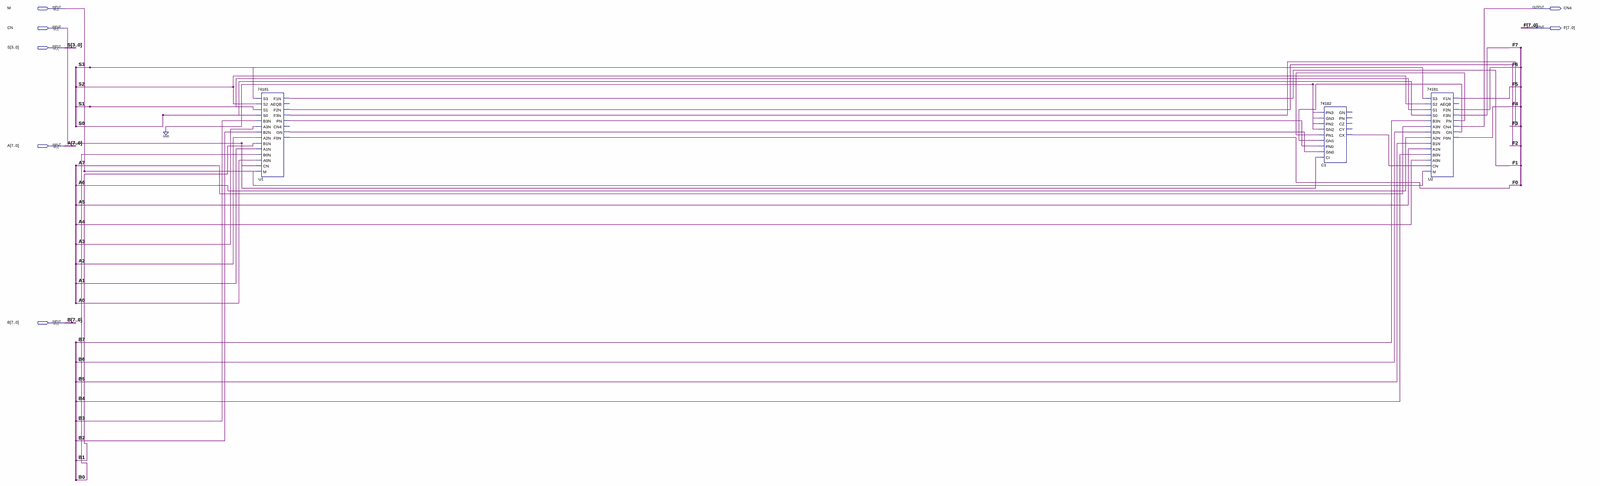
[diagram p0: schematic sheet, whole]
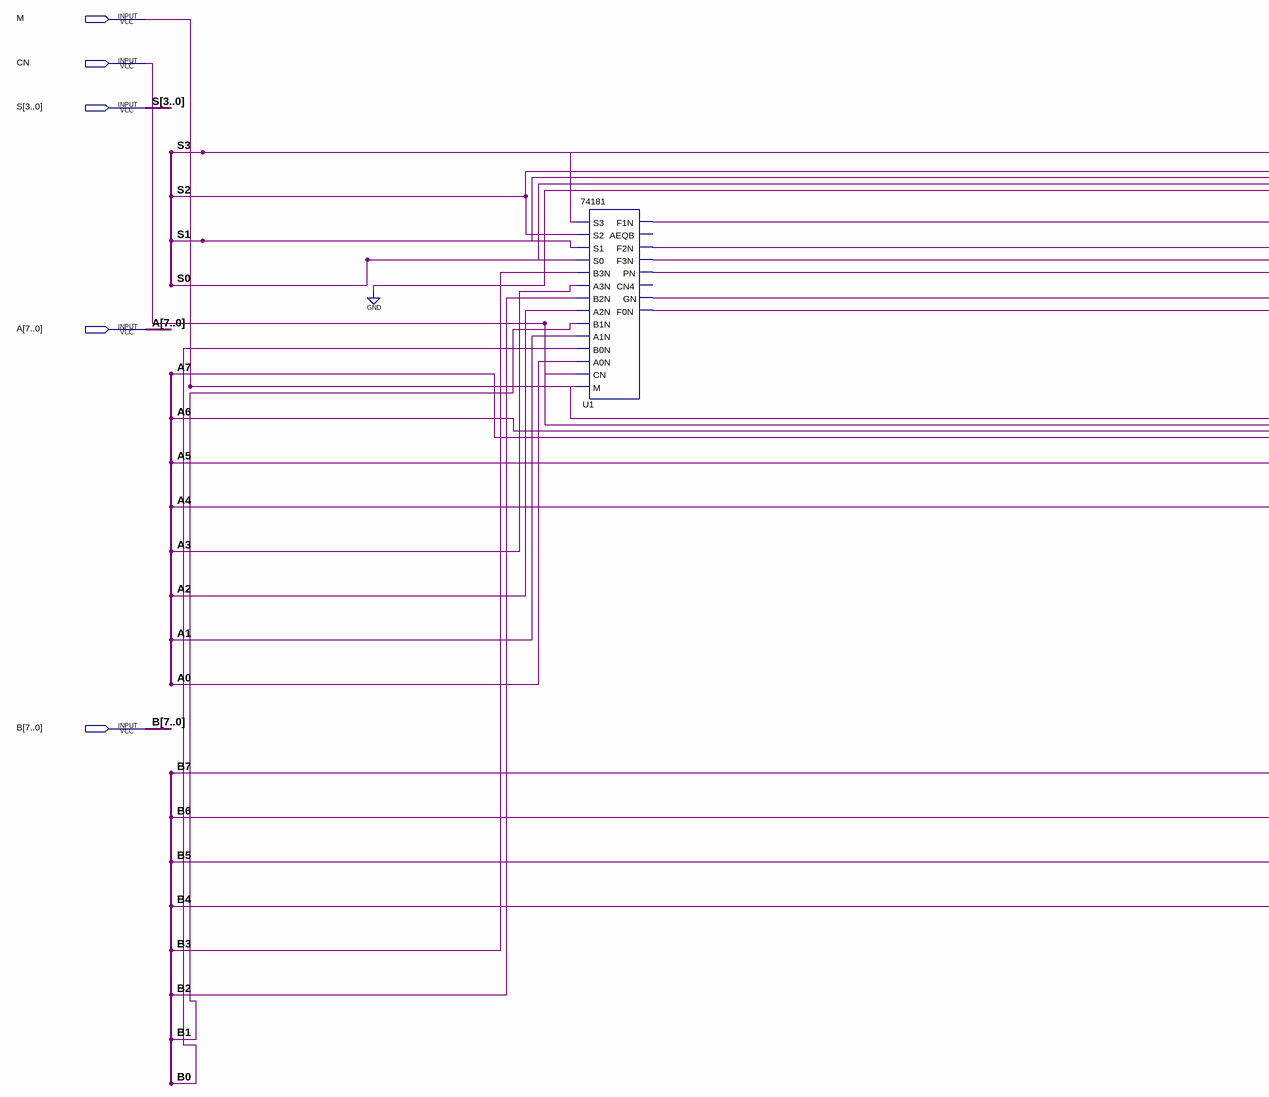
[diagram p1: schematic sheet, left part]
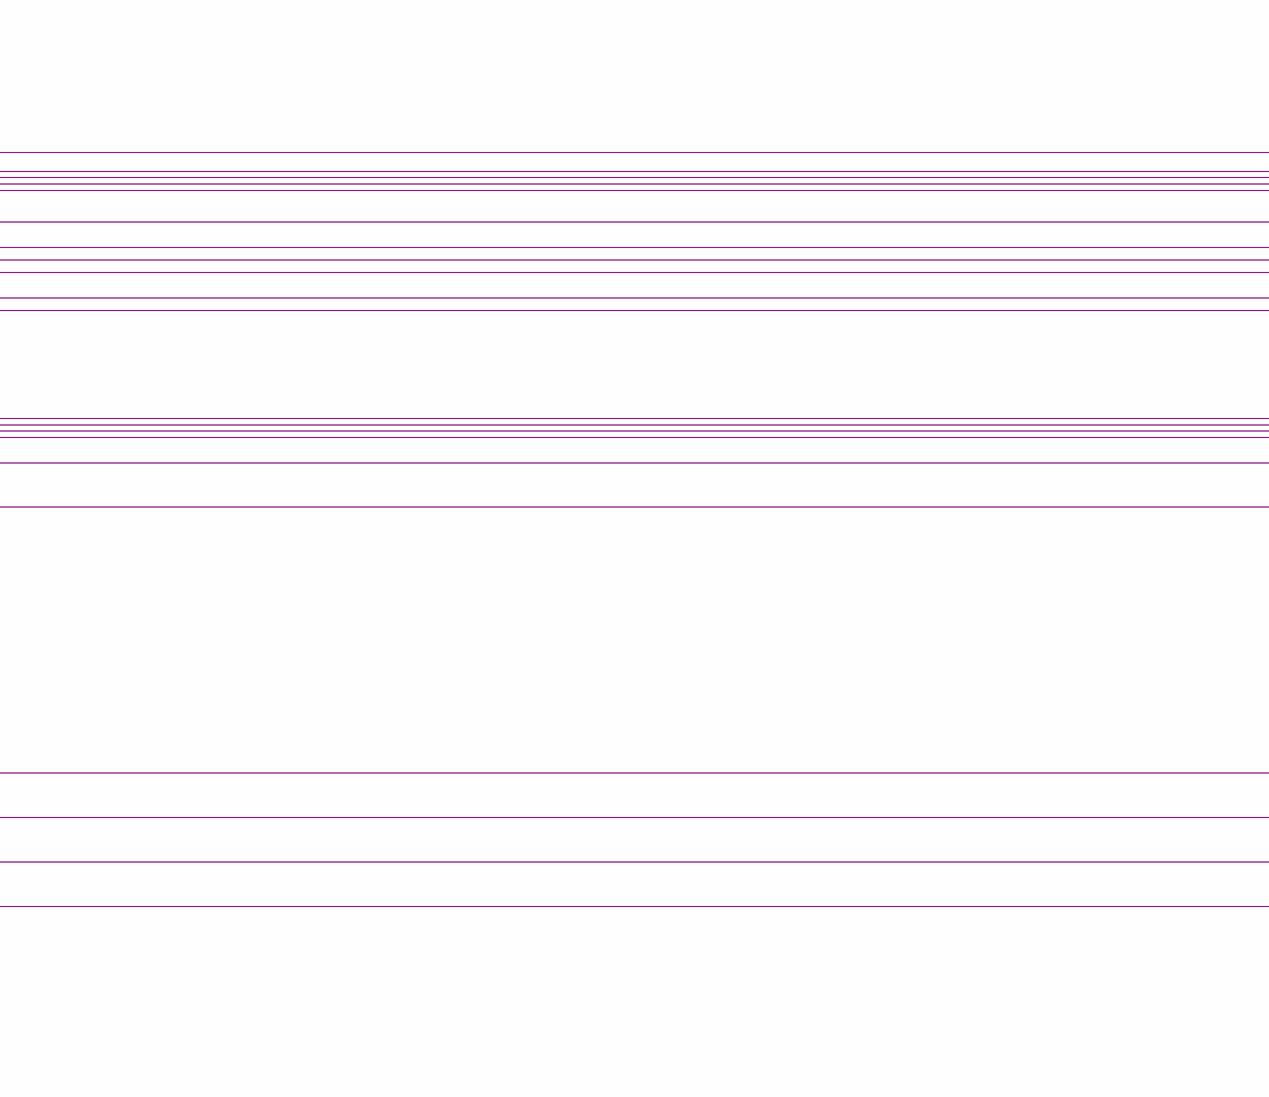
[diagram p2: schematic sheet, centre part]
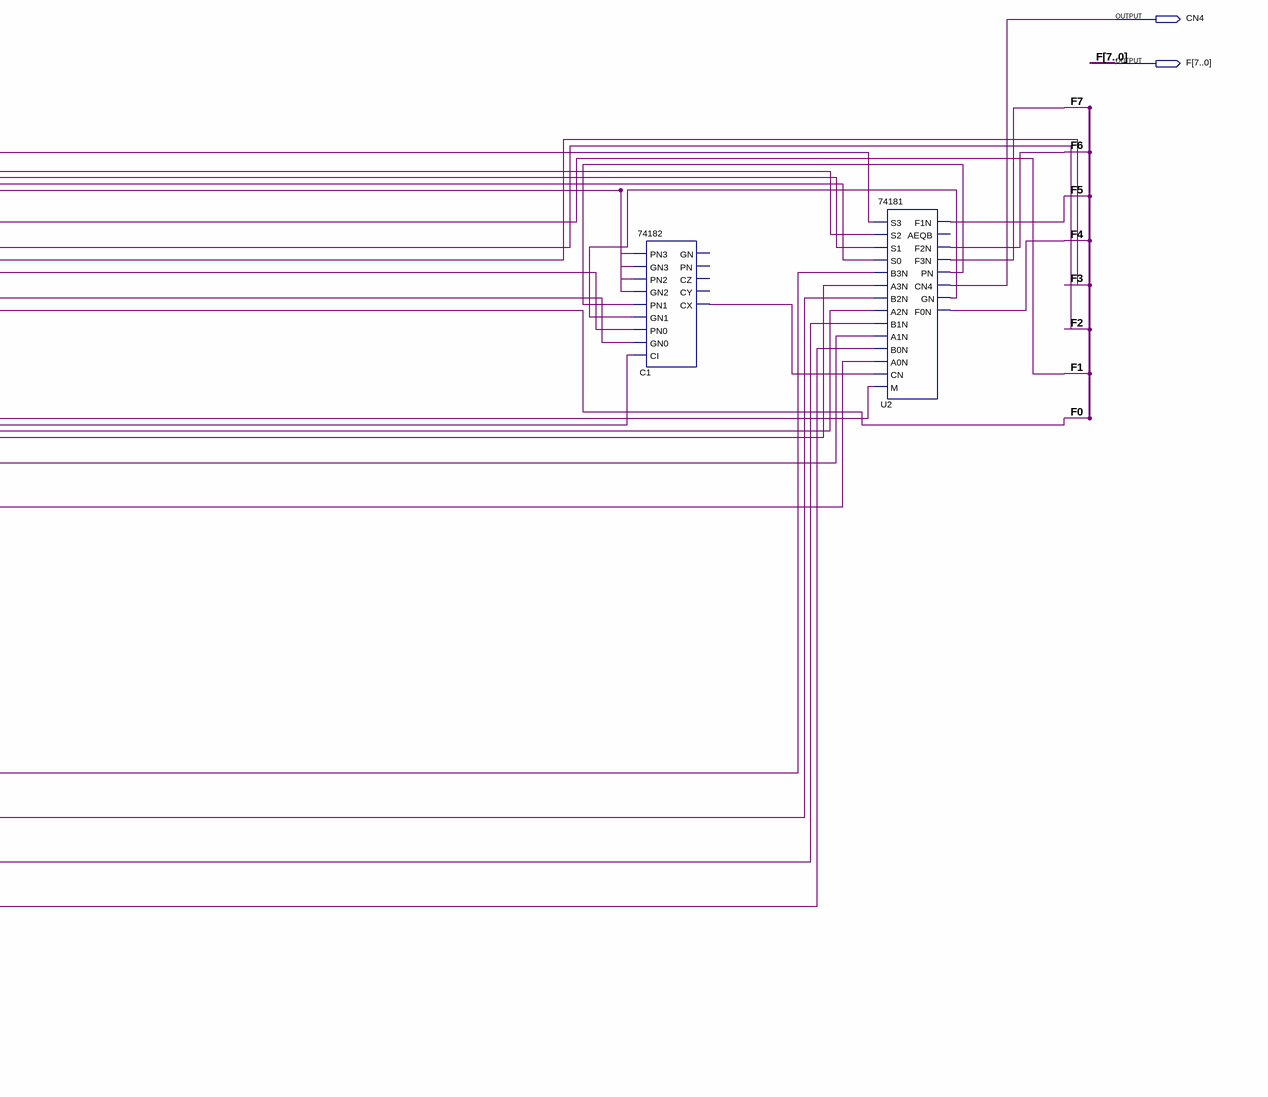
[diagram p3: schematic sheet, right part]
// Quartus schematic alu8la.bdf as structural Verilog: 3 symbols, 7 pins
module alu8la (
  input  M,
  input  CN,
  input  [3:0] S,
  input  [7:0] A,
  input  [7:0] B,
  output CN4,
  output [7:0] F
);

  wire C1_cx, U1_gn, U1_pn, U2_gn, U2_pn;

  \74181  U1 (
    .S3(S[3]), .S2(S[2]), .S1(S[1]), .S0(S[0]), .B3N(B[3]), .A3N(A[3]), .B2N(B[2]), .A2N(A[2]), .B1N(B[1]),
    .A1N(A[1]), .B0N(B[0]), .A0N(A[0]), .CN(CN), .M(M), .F1N(F[1]), .F2N(F[2]), .F3N(F[3]), .PN(U1_pn),
    .GN(U1_gn), .F0N(F[0]));  // open: AEQB, CN4
  \74182  C1 (
    .PN3(1'b0), .GN3(1'b0), .PN2(1'b0), .GN2(1'b0), .PN1(U2_pn), .GN1(U2_gn), .PN0(U1_pn), .GN0(U1_gn),
    .CI(CN), .CX(C1_cx));  // open: GN, PN, CZ, CY
  \74181  U2 (
    .S3(S[3]), .S2(S[2]), .S1(S[1]), .S0(S[0]), .B3N(B[7]), .A3N(A[7]), .B2N(B[6]), .A2N(A[6]), .B1N(B[5]),
    .A1N(A[5]), .B0N(B[4]), .A0N(A[4]), .CN(C1_cx), .M(M), .F1N(F[5]), .F2N(F[6]), .F3N(F[7]), .PN(U2_pn),
    .CN4(CN4), .GN(U2_gn), .F0N(F[4]));  // open: AEQB
endmodule
